# Altium schematic sheet PCB-PWR_02_3V8_MODEM.SchDoc
size 420 x 297 mm
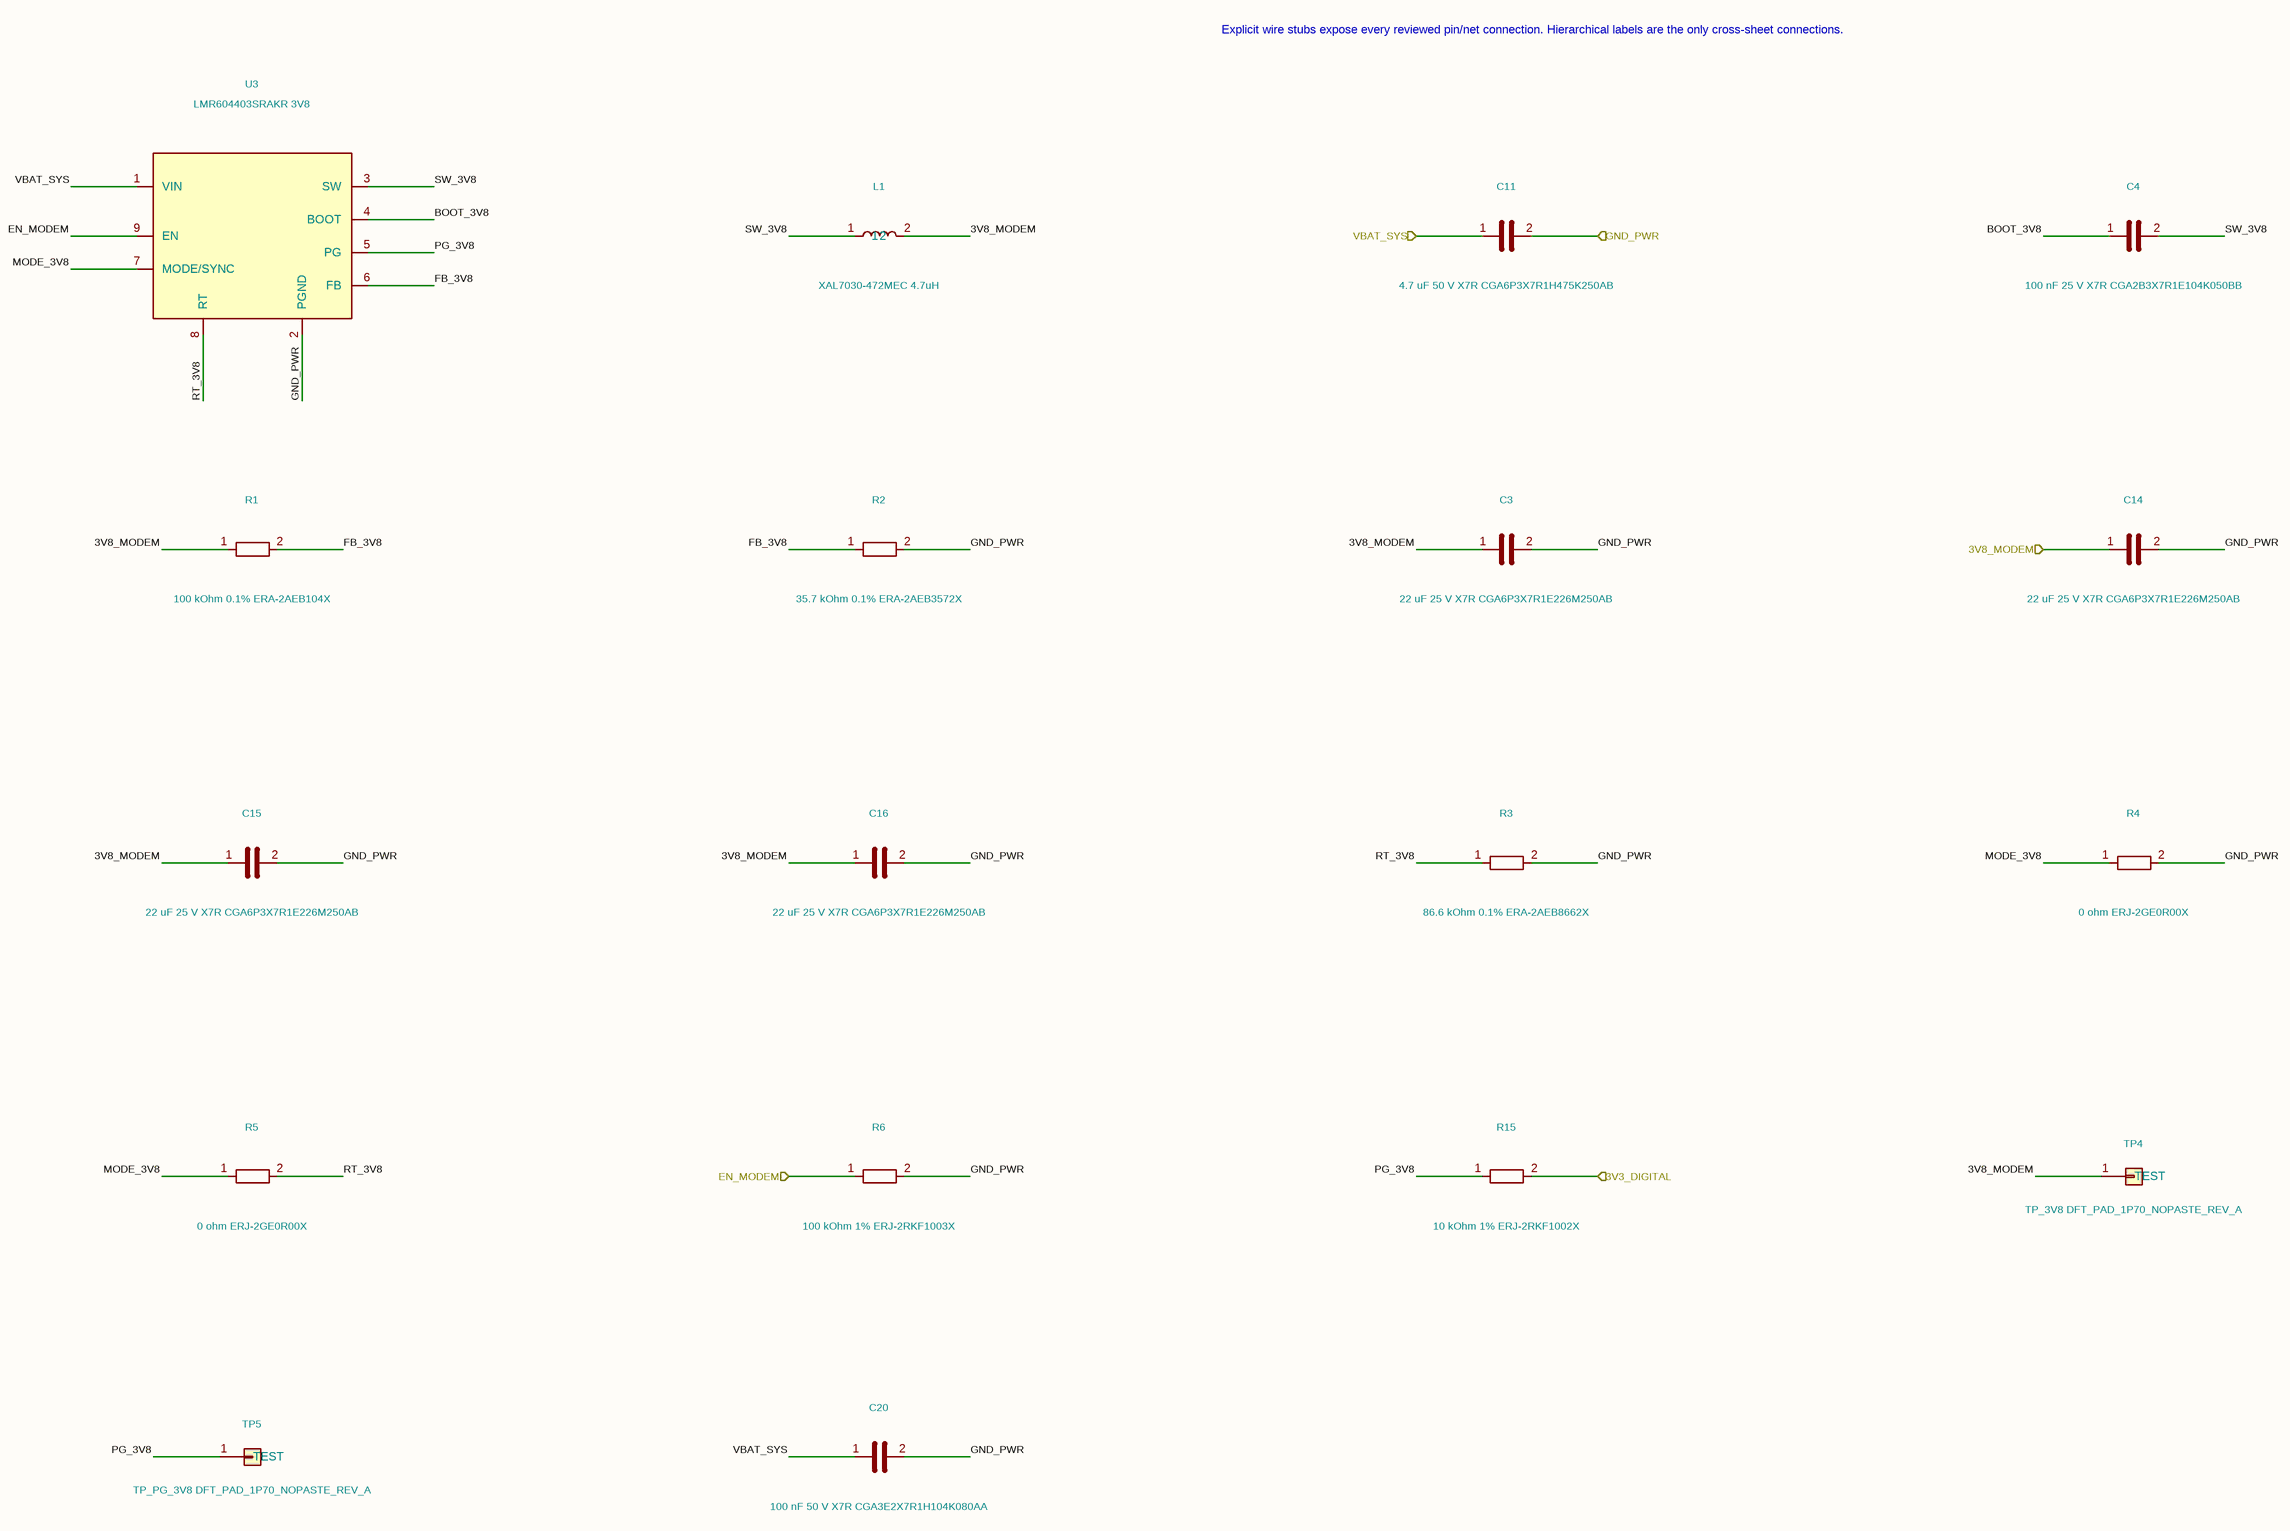
[diagram p0: PCB-PWR_02_3V8_MODEM.SchDoc]

## Parts
C3  22 uF 25 V X7R CGA6P3X7R1E226M250AB  [C_1210_3225Metric]
C4  100 nF 25 V X7R CGA2B3X7R1E104K050BB  [C_0402_1005Metric]
C11  4.7 uF 50 V X7R CGA6P3X7R1H475K250AB  [C_1210_3225Metric]
C14  22 uF 25 V X7R CGA6P3X7R1E226M250AB  [C_1210_3225Metric]
C15  22 uF 25 V X7R CGA6P3X7R1E226M250AB  [C_1210_3225Metric]
C16  22 uF 25 V X7R CGA6P3X7R1E226M250AB  [C_1210_3225Metric]
C20  100 nF 50 V X7R CGA3E2X7R1H104K080AA  [C_0603_1608Metric]
L1  XAL7030-472MEC 4.7uH  [Coilcraft_XAL7030_472]
R1  100 kOhm 0.1% ERA-2AEB104X  [R_0402_1005Metric]
R2  35.7 kOhm 0.1% ERA-2AEB3572X  [R_0402_1005Metric]
R3  86.6 kOhm 0.1% ERA-2AEB8662X  [R_0402_1005Metric]
R4  0 ohm ERJ-2GE0R00X  [R_0402_1005Metric]
R5  0 ohm ERJ-2GE0R00X  [R_0402_1005Metric]
R6  100 kOhm 1% ERJ-2RKF1003X  [R_0402_1005Metric]
R15  10 kOhm 1% ERJ-2RKF1002X  [R_0402_1005Metric]
TP4  TP_3V8 DFT_PAD_1P70_NOPASTE_REV_A  [TestPoint_DFT_1.7mm_NoPaste]
TP5  TP_PG_3V8 DFT_PAD_1P70_NOPASTE_REV_A  [TestPoint_DFT_1.7mm_NoPaste]
U3  LMR604403SRAKR 3V8  [LMR60440_RAK0009A]

## Ports
3V3_DIGITAL, 3V8_MODEM, EN_MODEM, GND_PWR, VBAT_SYS

## Nets
3V3_DIGITAL: R15.2 ; port 3V3_DIGITAL
3V8_MODEM: C14.1 ; port 3V8_MODEM
3V8_MODEM: C3.1 C15.1 C16.1 L1.2 R1.1 TP4.1(TEST)  [a separate net that carries the same name]
BOOT_3V8: C4.1 U3.4(BOOT)
EN_MODEM: R6.1 ; port EN_MODEM
EN_MODEM: U3.9(EN)  [a separate net that carries the same name]
FB_3V8: R1.2 R2.1 U3.6(FB)
GND_PWR: C11.2 ; port GND_PWR
GND_PWR: C3.2 C14.2 C15.2 C16.2 C20.2 R2.2 R3.2 R4.2 R6.2 U3.2(PGND)  [a separate net that carries the same name]
MODE_3V8: R4.1 R5.1 U3.7(MODE/SYNC)
PG_3V8: R15.1 TP5.1(TEST) U3.5(PG)
RT_3V8: R3.1 R5.2 U3.8(RT)
SW_3V8: C4.2 L1.1 U3.3(SW)
VBAT_SYS: C11.1 ; port VBAT_SYS
VBAT_SYS: C20.1 U3.1(VIN)  [a separate net that carries the same name]

## Notes on the sheet
- Explicit wire stubs expose every reviewed pin/net connection. Hierarchical labels are the only cross-sheet connections.
- 1
- 2
- 3
- 4
- 5
- 6
- 7
- 8
- A
- B
- C
- D
- E
- Human-readable hierarchy; exact pin/net equivalence enforced
- Functional sheet 3 of 5
- NOT FOR MANUFACTURE - routing/DRC/DFM/Review B pending
- Title: 3V8 modem rail
- File: PCB-PWR_02_3V8_MODEM.kicad_sch
- Sheet: /
- Dioneya / ZS-BPLA
- F
- KiCad E.D.A.  kicad (5.1.4)-1
- Size: A3
- Date: 2026-09-17
- Rev: A
- Id: 1/1

## Library data of the parts
C3 C4 C11 C14-C16 C20 = C
  C3 C14-C16: Value: 22 uF 25 V X7R CGA6P3X7R1E226M250AB; Footprint: Capacitor_SMD:C_1210_3225Metric
  C4: Value: 100 nF 25 V X7R CGA2B3X7R1E104K050BB; Footprint: Capacitor_SMD:C_0402_1005Metric
  C11: Value: 4.7 uF 50 V X7R CGA6P3X7R1H475K250AB; Footprint: Capacitor_SMD:C_1210_3225Metric
  C20: Value: 100 nF 50 V X7R CGA3E2X7R1H104K080AA; Footprint: Capacitor_SMD:C_0603_1608Metric
L1 = L: Value: XAL7030-472MEC 4.7uH; Footprint: DioneyaPWR:Coilcraft_XAL7030_472
R1-R6 R15 = R: Footprint: Resistor_SMD:R_0402_1005Metric
  R1: Value: 100 kOhm 0.1% ERA-2AEB104X
  R2: Value: 35.7 kOhm 0.1% ERA-2AEB3572X
  R3: Value: 86.6 kOhm 0.1% ERA-2AEB8662X
  R4 R5: Value: 0 ohm ERJ-2GE0R00X
  R6: Value: 100 kOhm 1% ERJ-2RKF1003X
  R15: Value: 10 kOhm 1% ERJ-2RKF1002X
TP4 TP5 = TESTPOINT: Footprint: DioneyaPWR:TestPoint_DFT_1.7mm_NoPaste
  TP4: Value: TP_3V8 DFT_PAD_1P70_NOPASTE_REV_A
  TP5: Value: TP_PG_3V8 DFT_PAD_1P70_NOPASTE_REV_A
U3 = Conn_01x09: Value: LMR604403SRAKR 3V8; Footprint: DioneyaPWR:LMR60440_RAK0009A